# EAGLE design mbc_83_24_03_23 (EAGLE 7.6.0)

## Sheet 1 of 3
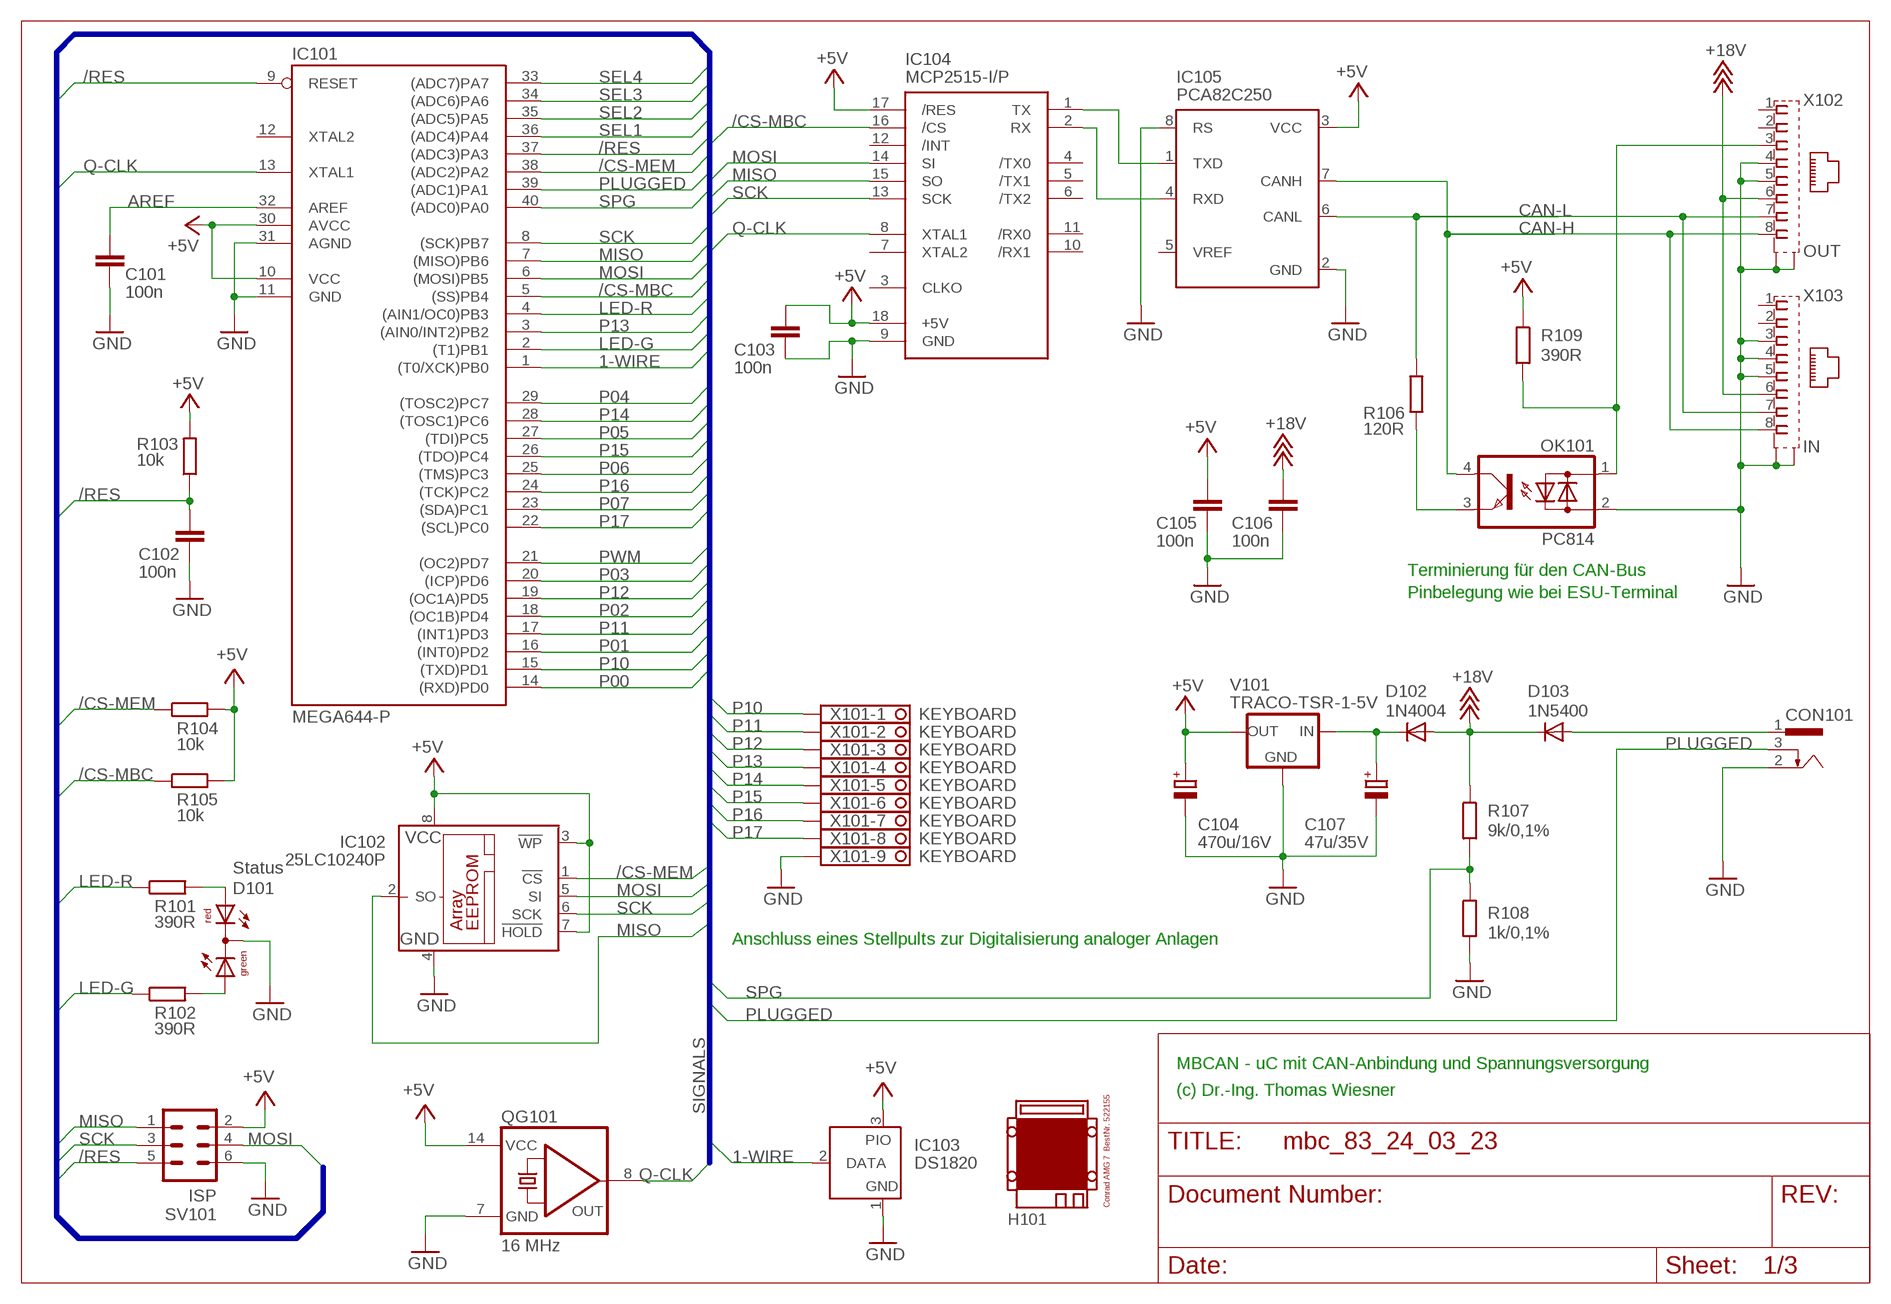
[diagram p0: schematic, sheet 1]

### Parts
C101  100n  C-EU025-025X050  [C025-025X050]
C102  100n  C-EU025-025X050  [C025-025X050]
C103  100n  C-EU025-025X050  [C025-025X050]
C104  470u/16V  CPOL-EUE3.5-8  [E3,5-8]
C105  100n  C-EU025-025X050  [C025-025X050]
C106  100n  C-EU025-025X050  [C025-025X050]
C107  47u/35V  CPOL-EUE2.5-7  [E2,5-7]
CON101  POWER-JACK  [POWER-JACK]
D101  Status  DUOLED5MM  [DUOLED5MM]
D102  1N4004  [DO41-10]
D103  1N5400  [DO201-15]
H101  MODULGEHÄUSE-AMG-7  [MODULGEHÄUSE-AMG-7]
IC101  MEGA644-P  MEGA323-P  [DIL40]
IC102  25LC10240P  25LC040P  [DIL8]
IC103  DS1820  DS2405  [TO92-]
IC104  MCP2515-I/P  MCP2510-I/P  [DIL18]
IC105  PCA82C250  [DIL08]
OK101  PC814  [DIL04]
QG101  16 MHz  QG5860  [DIL14S]
R101  390R  R-EU_0207/10  [0207/10]
R102  390R  R-EU_0207/10  [0207/10]
R103  10k  R-EU_0207/10  [0207/10]
R104  10k  R-EU_0207/10  [0207/10]
R105  10k  R-EU_0207/10  [0207/10]
R106  120R  R-EU_0207/10  [0207/10]
R107  9k/0,1%  R-EU_0207/10  [0207/10]
R108  1k/0,1%  R-EU_0207/10  [0207/10]
R109  390R  R-EU_0207/10  [0207/10]
SV101  ISP  ML6  [ML6]
V101  TRACO-TSR-1-5V  [TRACO-TSR-1]
X101  KEYBOARD  1751316  [1751316]
X102  OUT  0446200002  [0446200002]
X103  IN  0446200002  [0446200002]

### Nets
1-WIRE: IC101.1((T0/XCK)PB0) IC103.2(DATA)
+5V: C103.1 C104.+ C105.1 IC101.10(VCC) IC101.30(AVCC) IC102.3(!WP) IC102.7(!HOLD) IC102.8(VCC) IC103.3(PIO) IC104.17(/RES) IC104.18(+5V) IC105.3(VCC) QG101.14(VCC) R103.2 R104.2 R105.2 R109.1 SV101.2 V101.OUT ; also sheet 2
+18V: C106.1 D102.A D103.C R107.1 X102.6 X103.6 ; also sheet 2,3
/CS-MBC: IC101.5((SS)PB4) IC104.16(/CS) R105.1
/CS-MEM: IC101.38((ADC2)PA2) IC102.1(!CS) R104.1
/RES: C102.1 IC101.9(RESET) IC101.37((ADC3)PA3) R103.1 SV101.5
AREF: C101.1 IC101.32(AREF)
CAN-H: IC105.7(CANH) OK101.4(C) X102.8 X103.8
CAN-L: IC105.6(CANL) R106.2 X102.7 X103.7
GND: C101.2 C102.2 C103.2 C104.- C105.2 C106.2 C107.- CON101.2 D101.K(C) IC101.11(GND) IC101.31(AGND) IC102.4(GND) IC103.1(GND) IC104.9(GND) IC105.2(GND) IC105.8(RS) OK101.2(AC2) QG101.7(GND) R108.2 SV101.6 V101.GND X101.9 X102.4 X102.5 X102.S@1(S1) X102.S@2(S2) X103.3 X103.4 X103.5 X103.S@1(S1) X103.S@2(S2) ; also sheet 2,3
LED-G: IC101.2((T1)PB1) R102.1
LED-R: IC101.4((AIN1/OC0)PB3) R101.1
MISO: IC101.7((MISO)PB6) IC102.2(SO) IC104.15(SO) SV101.1
MOSI: IC101.6((MOSI)PB5) IC102.5(SI) IC104.14(SI) SV101.4
N$1: IC104.1(TX) IC105.1(TXD)
N$2: IC104.2(RX) IC105.4(RXD)
N$3: OK101.3(E) R106.1
N$5: OK101.1(AC1) R109.2 X102.3
N$6: C107.+ D102.C V101.IN
N$9: D101.AR R101.2
N$13: D101.AG R102.2
P00: IC101.14((RXD)PD0) ; also sheet 2
P01: IC101.16((INT0)PD2) ; also sheet 2
P02: IC101.18((OC1B)PD4) ; also sheet 2
P03: IC101.20((ICP)PD6) ; also sheet 2
P04: IC101.29((TOSC2)PC7) ; also sheet 2
P05: IC101.27((TDI)PC5) ; also sheet 2
P06: IC101.25((TMS)PC3) ; also sheet 2
P07: IC101.23((SDA)PC1) ; also sheet 2
P10: IC101.15((TXD)PD1) X101.1
P11: IC101.17((INT1)PD3) X101.2
P12: IC101.19((OC1A)PD5) X101.3
P13: IC101.3((AIN0/INT2)PB2) X101.4
P14: IC101.28((TOSC1)PC6) X101.5
P15: IC101.26((TDO)PC4) X101.6
P16: IC101.24((TCK)PC2) X101.7
P17: IC101.22((SCL)PC0) X101.8
PLUGGED: CON101.3 IC101.39((ADC1)PA1)
PWM: IC101.21((OC2)PD7) ; also sheet 3
Q-CLK: IC101.13(XTAL1) IC104.8(XTAL1) QG101.8(OUT)
SCK: IC101.8((SCK)PB7) IC102.6(SCK) IC104.13(SCK) SV101.3
SEL1: IC101.36((ADC4)PA4) ; also sheet 2
SEL2: IC101.35((ADC5)PA5) ; also sheet 2
SEL3: IC101.34((ADC6)PA6) ; also sheet 2
SEL4: IC101.33((ADC7)PA7) ; also sheet 2
SPG: IC101.40((ADC0)PA0) R107.2 R108.1
V-NETZTEIL1: CON101.1 D103.A
Unconnected: IC101.12(XTAL2) IC104.3(CLKO) IC104.4(/TX0) IC104.5(/TX1) IC104.6(/TX2) IC104.7(XTAL2) IC104.10(/RX1) IC104.11(/RX0) IC104.12(/INT) IC105.5(VREF) X102.1 X102.2 X103.1 X103.2

### Buses
SIGNALS

### Notes on the sheet
- Terminierung für den CAN-Bus
- Pinbelegung wie bei ESU-Terminal
- Anschluss eines Stellpults zur Digitalisierung analoger Anlagen
- MBCAN - uC mit CAN-Anbindung und Spannungsversorgung
- (c) Dr.-Ing. Thomas Wiesner

## Sheet 2 of 3
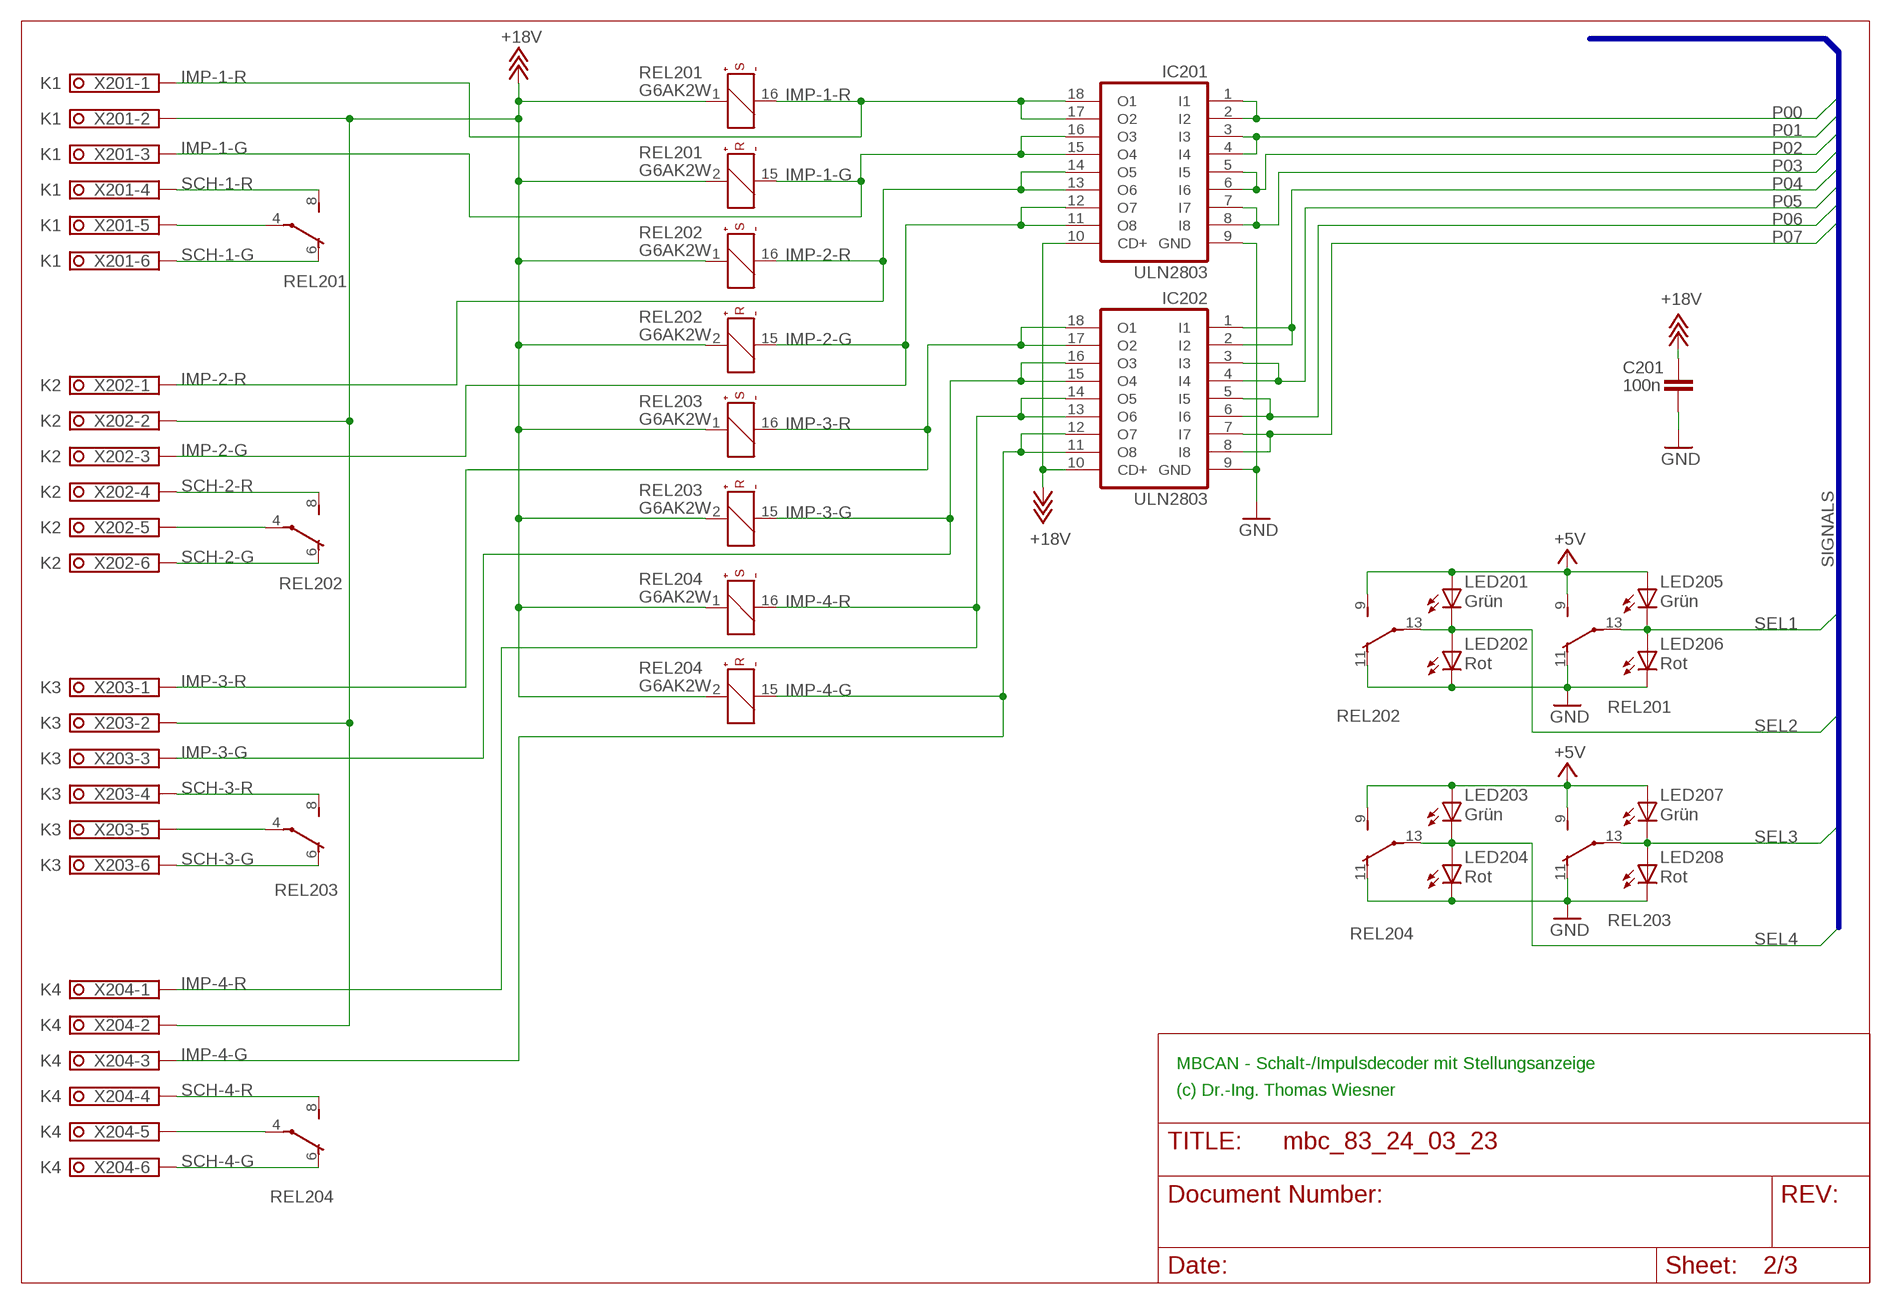
[diagram p1: schematic, sheet 2]

### Parts
C201  100n  C-EU025-025X050  [C025-025X050]
IC201  ULN2803  ULN2803A  [DIL18]
IC202  ULN2803  ULN2803A  [DIL18]
LED201  Grün  LED3MM  [LED3MM]
LED202  Rot  LED3MM  [LED3MM]
LED203  Grün  LED3MM  [LED3MM]
LED204  Rot  LED3MM  [LED3MM]
LED205  Grün  LED3MM  [LED3MM]
LED206  Rot  LED3MM  [LED3MM]
LED207  Grün  LED3MM  [LED3MM]
LED208  Rot  LED3MM  [LED3MM]
REL201  G6AK2W  [REL-BIPOLAR]
REL202  G6AK2W  [REL-BIPOLAR]
REL203  G6AK2W  [REL-BIPOLAR]
REL204  G6AK2W  [REL-BIPOLAR]
X201  K1  1751280  [1751280]
X202  K2  1751280  [1751280]
X203  K3  1751280  [1751280]
X204  K4  1751280  [1751280]

### Nets
+5V: LED201.A LED203.A LED205.A LED207.A REL201.9(S) REL202.9(S) REL203.9(S) REL204.9(S) ; also sheet 1
+18V: C201.1 IC201.10(CD+) IC202.10(CD+) REL201.1(+) REL201.2(+) REL202.1(+) REL202.2(+) REL203.1(+) REL203.2(+) REL204.1(+) REL204.2(+) X201.2 X202.2 X203.2 X204.2 ; also sheet 1,3
GND: C201.2 IC201.9(GND) IC202.9(GND) LED202.K(C) LED204.K(C) LED206.K(C) LED208.K(C) REL201.11(O) REL202.11(O) REL203.11(O) REL204.11(O) ; also sheet 1,3
IMP-1-G: IC201.15(O4) IC201.16(O3) REL201.15(-) X201.3 ; also sheet 3
IMP-1-R: IC201.17(O2) IC201.18(O1) REL201.16(-) X201.1 ; also sheet 3
IMP-2-G: IC201.11(O8) IC201.12(O7) REL202.15(-) X202.3 ; also sheet 3
IMP-2-R: IC201.13(O6) IC201.14(O5) REL202.16(-) X202.1 ; also sheet 3
IMP-3-G: IC202.15(O4) IC202.16(O3) REL203.15(-) X203.3 ; also sheet 3
IMP-3-R: IC202.17(O2) IC202.18(O1) REL203.16(-) X203.1 ; also sheet 3
IMP-4-G: IC202.11(O8) IC202.12(O7) REL204.15(-) X204.3 ; also sheet 3
IMP-4-R: IC202.13(O6) IC202.14(O5) REL204.16(-) X204.1 ; also sheet 3
N$12: REL202.4(P) X202.5
N$14: REL201.4(P) X201.5
N$15: REL203.4(P) X203.5
N$16: REL204.4(P) X204.5
P00: IC201.1(I1) IC201.2(I2) ; also sheet 1
P01: IC201.3(I3) IC201.4(I4) ; also sheet 1
P02: IC201.5(I5) IC201.6(I6) ; also sheet 1
P03: IC201.7(I7) IC201.8(I8) ; also sheet 1
P04: IC202.1(I1) IC202.2(I2) ; also sheet 1
P05: IC202.3(I3) IC202.4(I4) ; also sheet 1
P06: IC202.5(I5) IC202.6(I6) ; also sheet 1
P07: IC202.7(I7) IC202.8(I8) ; also sheet 1
SCH-1-G: REL201.6(O) X201.6 ; also sheet 3
SCH-1-R: REL201.8(S) X201.4
SCH-2-G: REL202.6(O) X202.6 ; also sheet 3
SCH-2-R: REL202.8(S) X202.4
SCH-3-G: REL203.6(O) X203.6 ; also sheet 3
SCH-3-R: REL203.8(S) X203.4
SCH-4-G: REL204.6(O) X204.6 ; also sheet 3
SCH-4-R: REL204.8(S) X204.4
SEL1: LED205.K(C) LED206.A REL201.13(P) ; also sheet 1
SEL2: LED201.K(C) LED202.A REL202.13(P) ; also sheet 1
SEL3: LED207.K(C) LED208.A REL203.13(P) ; also sheet 1
SEL4: LED203.K(C) LED204.A REL204.13(P) ; also sheet 1

### Buses
SIGNALS

### Notes on the sheet
- MBCAN - Schalt-/Impulsdecoder mit Stellungsanzeige
- (c) Dr.-Ing. Thomas Wiesner

## Sheet 3 of 3
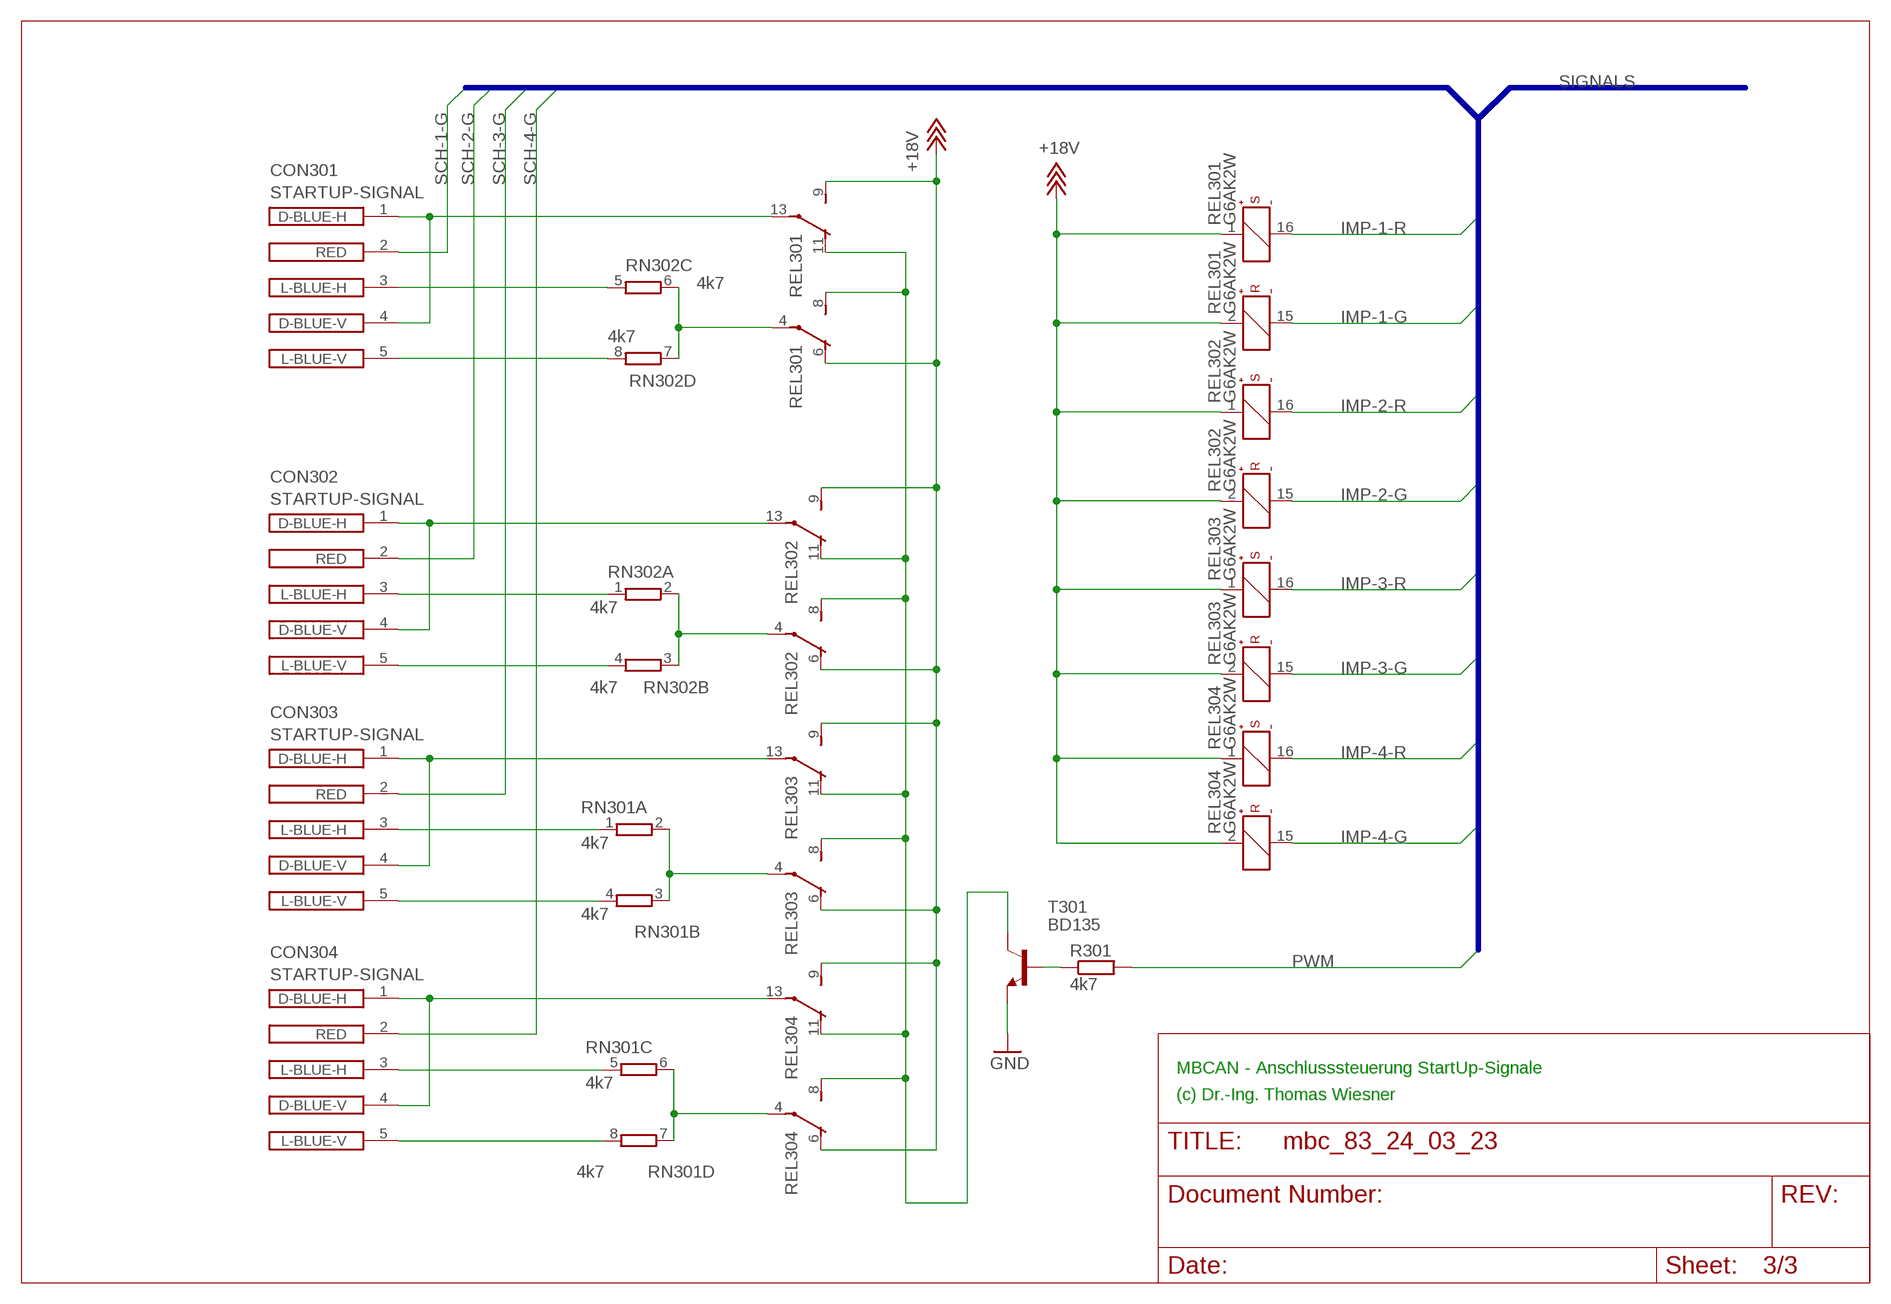
[diagram p2: schematic, sheet 3]

### Parts
CON301  STARTUP-SIGNAL  [SIGNAL-MAIN]
CON302  STARTUP-SIGNAL  [SIGNAL-MAIN]
CON303  STARTUP-SIGNAL  [SIGNAL-MAIN]
CON304  STARTUP-SIGNAL  [SIGNAL-MAIN]
R301  4k7  R-EU_0207/10  [0207/10]
REL301  G6AK2W  [REL-BIPOLAR]
REL302  G6AK2W  [REL-BIPOLAR]
REL303  G6AK2W  [REL-BIPOLAR]
REL304  G6AK2W  [REL-BIPOLAR]
RN301  4k7  E4R  [SIL8]
RN302  4k7  E4R  [SIL8]
T301  BD135  -NPN-TO126V  [TO126V]

### Nets
+18V: REL301.1(+) REL301.2(+) REL301.6(O) REL301.9(S) REL302.1(+) REL302.2(+) REL302.6(O) REL302.9(S) REL303.1(+) REL303.2(+) REL303.6(O) REL303.9(S) REL304.1(+) REL304.2(+) REL304.6(O) REL304.9(S) ; also sheet 1,2
GND: T301.1(E) ; also sheet 1,2
IMP-1-G: REL301.15(-) ; also sheet 2
IMP-1-R: REL301.16(-) ; also sheet 2
IMP-2-G: REL302.15(-) ; also sheet 2
IMP-2-R: REL302.16(-) ; also sheet 2
IMP-3-G: REL303.15(-) ; also sheet 2
IMP-3-R: REL303.16(-) ; also sheet 2
IMP-4-G: REL304.15(-) ; also sheet 2
IMP-4-R: REL304.16(-) ; also sheet 2
N$4: CON302.5(L-BLUE-V) RN302.4
N$7: CON301.1(D-BLUE-H) CON301.4(D-BLUE-V) REL301.13(P)
N$8: CON301.5(L-BLUE-V) RN302.8
N$10: CON303.5(L-BLUE-V) RN301.4
N$11: CON304.5(L-BLUE-V) RN301.8
N$17: R301.1 T301.3(B)
N$18: REL301.8(S) REL301.11(O) REL302.8(S) REL302.11(O) REL303.8(S) REL303.11(O) REL304.8(S) REL304.11(O) T301.2(C)
N$19: CON302.1(D-BLUE-H) CON302.4(D-BLUE-V) REL302.13(P)
N$20: CON302.3(L-BLUE-H) RN302.1
N$21: CON304.1(D-BLUE-H) CON304.4(D-BLUE-V) REL304.13(P)
N$23: CON304.3(L-BLUE-H) RN301.5
N$24: CON303.1(D-BLUE-H) CON303.4(D-BLUE-V) REL303.13(P)
N$26: CON301.3(L-BLUE-H) RN302.5
N$27: CON303.3(L-BLUE-H) RN301.1
N$29: REL301.4(P) RN302.6 RN302.7
N$30: REL302.4(P) RN302.2 RN302.3
N$31: REL303.4(P) RN301.2 RN301.3
N$32: REL304.4(P) RN301.6 RN301.7
PWM: R301.2 ; also sheet 1
SCH-1-G: CON301.2(RED) ; also sheet 2
SCH-2-G: CON302.2(RED) ; also sheet 2
SCH-3-G: CON303.2(RED) ; also sheet 2
SCH-4-G: CON304.2(RED) ; also sheet 2

### Buses
SIGNALS

### Notes on the sheet
- MBCAN - Anschlusssteuerung StartUp-Signale
- (c) Dr.-Ing. Thomas Wiesner

## Library data of the parts
C101-C103 C105 C106 C201 = rcl:C-EU: CAPACITOR, European symbol
C104 C107 = rcl:CPOL-EU: POLARIZED CAPACITOR, European symbol
CON101 = mbc:POWER-JACK: Power-Stecker für 2,5 mm Hohlbuchse
CON301-CON304 = mbc:STARTUP-SIGNAL: Connector für StartUp-Signale
D101 = led:DUOLED5MM: DUO LED 2 colors, 5 mm, round
D102 = diode:1N4004: DIODE general purpose rectifier, 1 A
D103 = diode:1N5400: DIODE standard rectifier, 3 A, 50 V (Motorola)
H101 = mbc:MODULGEHÄUSE-AMG-7: Gehäuse Conrad AMG 7 BestNr. 522155
IC101 = atmel:MEGA323-P: MICROCONTROLLER 32 Kbytes FLASH 2 Kbytes SRAM 1 Kbytes EEPROM USART 8-channel 10 bit ADC Source: avr.lbr; OC_FARNELL: unknown; OC_NEWARK: unknown
IC102 = microchip:25*: Serial EEPROM 4K/ 8K , SPI bus; MF: MICROCHIP; MPN: 25LC040/P; OC_FARNELL: 9758100; OC_NEWARK: 96K4091
IC103 = maxim:DS2405: Addressable Switch DALLAS Semiconductor; MF: DALLAS SEMICONDUCTOR; MPN: DS2405; OC_FARNELL: 1188025; OC_NEWARK: 06F4645
IC104 = mbc:MCP2510: BASIC-CAN 2.0a Controller Stand-alone CAN controller von Microchip
IC105 = micro-philips:PCA82C250: CAN CONTROLLER INTERFACE; OC_FARNELL: 3692358; OC_NEWARK: unknown
IC201 IC202 = uln-udn:ULN2803A: DRIVER ARRAY
LED201-LED208 = led:LED: LED OSRAM: - CHIPLED LG R971, LG N971, LY N971, LG Q971, LY Q971, LO R971, LY R971 LH N974, LH R974 LS Q976, LO Q976, LY Q976 LO Q996 - Hyper CHIPLED LW Q18S LB Q993, LB Q99A, LB R99A - SideLED LS A670, LO A670, LY A670, LG A670, LP A670 LB A673, LV A673, LT A673, LW A673 LH A674 LY A675 LS A676, LA A676, LO A676, LY A676, LW A676 LS A679, LY A679, LG A679 - Hyper Micro SIDELED® LS Y876, LA Y876, LO Y876, LY Y876 LT Y87S - SmartLED LW L88C, LW L88S LB L89C, LB L89S, LG L890 LS L89K, LO L89K, LY L89K LS L896, LA L896, LO L896, LY L896 - TOPLED LS T670, LO T670, LY T670, LG T670, LP T670 LSG T670, LSP T670, LSY T670, LOP T670, LYG T670 LG T671, LOG T671, LSG T671 LB T673, LV T673, LT T673, LW T673 LH T674 LS T676, LA T676, LO T676, LY T676, LB T676, LH T676, LSB T676, LW T676 LB T67C, LV T67C, LT T67C, LS T67K, LO T67K, LY T67K, LW E67C LS E67B, LA E67B, LO E67B, LY E67B, LB E67C, LV E67C, LT E67C LW T67C LS T679, LY T679, LG T679 LS T770, LO T770, LY T770, LG T770, LP T770 LB T773, LV T773, LT T773, LW T773 LH T774 LS E675, LA E675, LY E675, LS T675 LS T776, LA T776, LO T776, LY T776, LB T776 LHGB T686 LT T68C, LB T68C - Hyper Mini TOPLED® LB M676 - Mini TOPLED Santana® LG M470 LS M47K, LO M47K, LY M47K Source: http://www.osram.convergy.de LUXEON: - LUMILED® LXK2-PW12-R00, LXK2-PW12-S00, LXK2-PW14-U00, LXK2-PW14-V00 LXK2-PM12-R00, LXK2-PM12-S00, LXK2-PM14-U00 LXK2-PE12-Q00, LXK2-PE12-R00, LXK2-PE12-S00, LXK2-PE14-T00, LXK2-PE14-U00 LXK2-PB12-K00, LXK2-PB12-L00, LXK2-PB12-M00, LXK2-PB14-N00, LXK2-PB14-P00, LXK2-PB14-Q00 LXK2-PR12-L00, LXK2-PR12-M00, LXK2-PR14-Q00, LXK2-PR14-R00 LXK2-PD12-Q00, LXK2-PD12-R00, LXK2-PD12-S00 LXK2-PH12-R00, LXK2-PH12-S00 LXK2-PL12-P00, LXK2-PL12-Q00, LXK2-PL12-R00 Source: www.luxeon.com KINGBRIGHT: KA-3528ASYC Source: www.kingbright.com
OK101 = optocoupler:PC814: SHARP OPTO COUPLER; OC_FARNELL: 9707662; OC_NEWARK: unknown
QG101 = crystal:QG5860: CRYSTAL RESONATOR; OC_FARNELL: unknown; OC_NEWARK: unknown
R101-R109 R301 = resistor:R-EU_: RESISTOR, European symbol
REL201-REL204 REL301-REL304 = mbc:G6AK2W: Bipolares Relais 2xUM 12V
RN301 RN302 = resistor-sil:E4R: SIL RESISTOR; OC_FARNELL: unknown; OC_NEWARK: unknown
SV101 = con-ml:ML6: HARTING; OC_FARNELL: unknown; OC_NEWARK: unknown
T301 = transistor:*-NPN-: NPN Transistror BF959 corrected 2008.03.06
V101 = mbc:TRACO-TSR-1-5V: Spannungsregler Hersteller: TRACO Typ: TSR-1 5V: TSR 1-2450 Spg: 5V Strom: 1A Reichelt TSR 1-2450
X101 = con-phoenix-350:1751316: MKDS 1/ 9-3,5 Printklemme Nennstrom: 10 A Bemessungsspannung: 160 V Raster: 3,5 mm Polzahl: 9 Montageart: Löten Anschlussart: Schraubanschluss Anschlussrichtung vom Leiter zur Platine: 0° Source: http://eshop.phoenixcontact.com .. 1751316.pdf; OC_FARNELL: unknown; OC_NEWARK: unknown
X102 X103 = mbc:0446200002: RJ-45 INVERTED MODULAR JACK ASSEMBLY WITH RJ-11 KEEPOUT FEATURE Source: Data sheet <http://www.farnell.com/datasheets/73207.pdf> MOLEX 0446200002 BUCHSE, RJ45, GESCHIRMT Source: Farnell <http://de.farnell.com/molex/0446200002/buchse-rj45-geschirmt/dp/9251910?ost=9251910>; MF: MOLEX; MPN: 0446200002; OC_FARNELL: 9251910
X201-X204 = con-phoenix-350:1751280: MKDS 1/ 6-3,5 Printklemme Nennstrom: 10 A Bemessungsspannung: 160 V Raster: 3,5 mm Polzahl: 6 Montageart: Löten Anschlussart: Schraubanschluss Anschlussrichtung vom Leiter zur Platine: 0° Source: http://eshop.phoenixcontact.com .. 1751280.pdf; MPN: 1751280; OC_FARNELL: unknown; OC_NEWARK: 27R1765

## Board
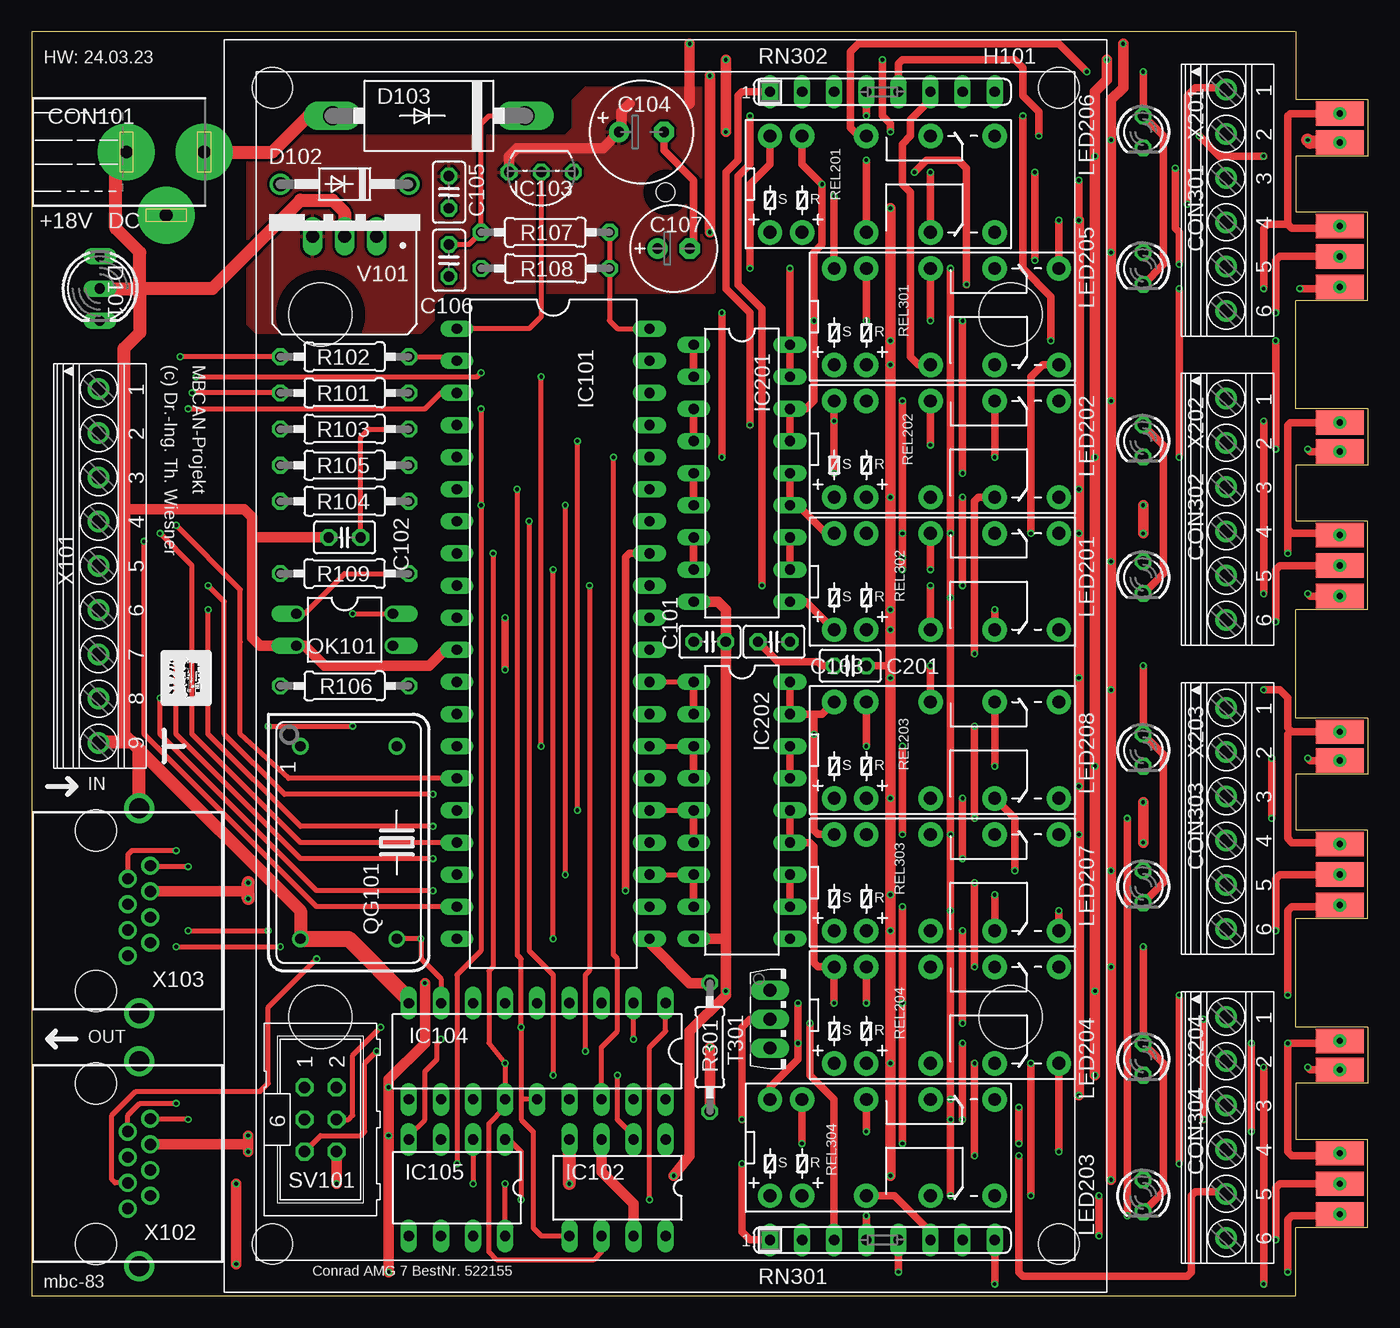
[diagram p3: board, top side]
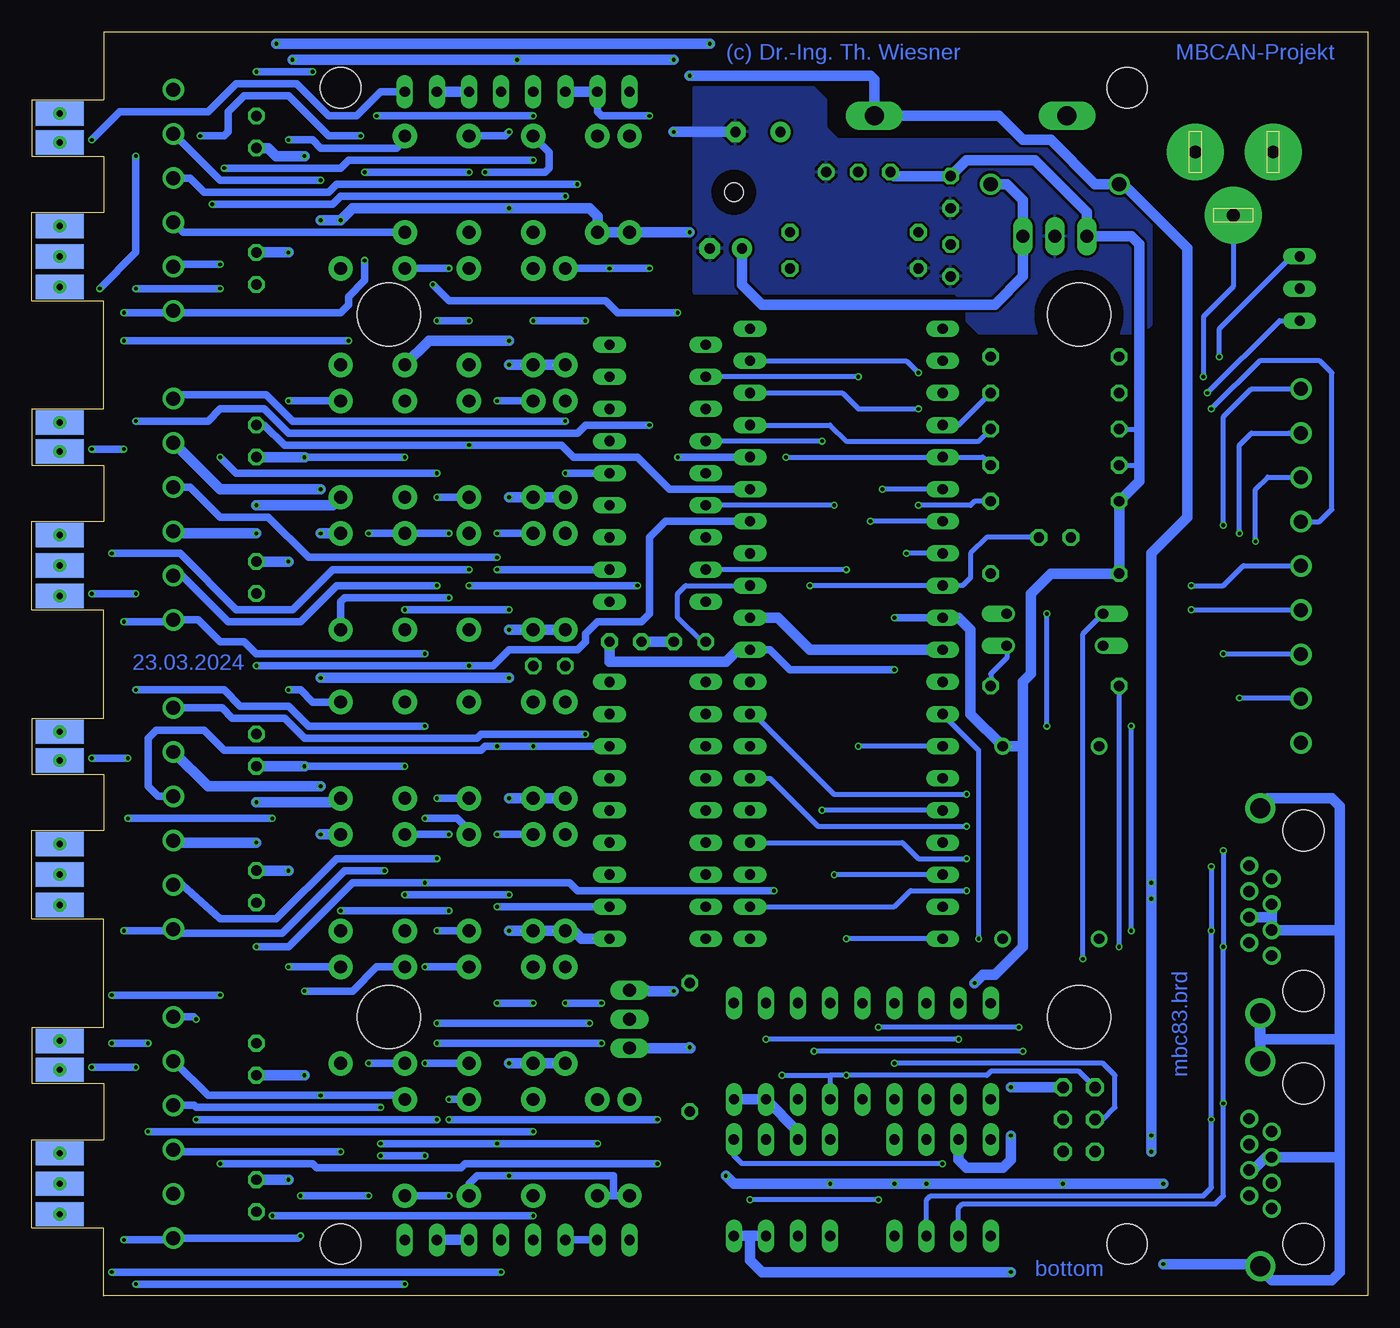
[diagram p4: board, bottom side, seen from below]

Size 105.73 x 100.01 mm. Coordinates in mm from the lower left corner, seen from the top.
Outline: 100,0.02 0,0.02 0,100.01 100,100.01
Outline: 100.01,100.01 100.01,94.61
Outline: 100.01,0 100.01,5.4
Outline: 100.01,21.27 100.01,29.84
Outline: 100.01,45.72 100.01,54.29
Outline: 100.01,70.17 100.01,78.74
Copper layers (1*16): Top 0.035mm / dielectric 1.5mm / Bottom 0.035mm
Design rules "default *": minimum track width 10mil, minimum drill 0.3mm, track to track 8mil, track to pad 8mil, pad to pad 8mil, via to via 8mil, smd to smd 8mil, copper to edge 40mil, drill to drill 8mil, minimum pad ring 10mil, minimum via ring 0.125mm, stop-mask expansion 4mil, vias tented up to drill 0mil, thermal gap 10mil

### Footprints (pad centres in the part's own frame; a part is rotated, then mirrored left to right if it is on the bottom)
C025-025X050 = drill 0.813 octagon: 1 -1.27,0; 2 1.27,0
E3,5-8 = drill 0.813 pad 1.6: + -1.778,0 | drill 0.813 pad 1.6 octagon: - 1.778,0
E2,5-7 = drill 0.813 pad 1.6: + -1.27,0 | drill 0.813 pad 1.6 octagon: - 1.27,0
POWER-JACK = drill 1 pad 4.5: 1 0,6.03; 2 0,-0.12; 3 5,3.03
SIGNAL-MAIN = smd 3.81 x 1.93: 1 -3.493,1.079; 2 -3.493,3.493; 3 -3.493,5.905; 4 -3.493,-7.811; 5 -3.493,-5.524 | smd 3.81 x 1.93 bottom: 6 -3.493,-5.524; 7 -3.493,-7.811; 8 -3.493,5.905; 9 -3.493,3.493; 10 -3.493,1.079 | drill 0.5 pad 0.813: P$7 -3.493,5.905; P$8 -3.493,3.493; P$9 -3.493,1.079; P$14 -3.493,-7.811; P$15 -3.493,-5.524
DUOLED5MM = drill 0.813 long: AG -2.54,0; AR 2.54,0; K 0,0
DO41-10 = drill 1.118: A 5.08,0; C -5.08,0
DO201-15 = drill 1.499 long: A 7.62,0; C -7.62,0
MODULGEHÄUSE-AMG-7 = hole 3.2: -45.72,-31.115; -45.72,31.115; 45.72,31.115; 45.72,-31.115 | hole 5: -27.781,-27.305; 27.781,-27.305; -27.781,27.305; 27.781,27.305 | hole 1.5: -37.465,0
DIL40 = drill 0.813 long: 1 -24.13,-7.62; 2 -21.59,-7.62; 3 -19.05,-7.62; 4 -16.51,-7.62; 5 -13.97,-7.62; 6 -11.43,-7.62; 7 -8.89,-7.62; 8 -6.35,-7.62; 9 -3.81,-7.62; 10 -1.27,-7.62; 11 1.27,-7.62; 12 3.81,-7.62; 13 6.35,-7.62; 14 8.89,-7.62; 15 11.43,-7.62; 16 13.97,-7.62; 17 16.51,-7.62; 18 19.05,-7.62; 19 21.59,-7.62; 20 24.13,-7.62; 21 24.13,7.62; 22 21.59,7.62; 23 19.05,7.62; 24 16.51,7.62; 25 13.97,7.62; 26 11.43,7.62; 27 8.89,7.62; 28 6.35,7.62; 29 3.81,7.62; 30 1.27,7.62; 31 -1.27,7.62; 32 -3.81,7.62; 33 -6.35,7.62; 34 -8.89,7.62; 35 -11.43,7.62; 36 -13.97,7.62; 37 -16.51,7.62; 38 -19.05,7.62; 39 -21.59,7.62; 40 -24.13,7.62
DIL8 = drill 0.813 long: 1 -3.81,-3.81; 2 -1.27,-3.81; 3 1.27,-3.81; 4 3.81,-3.81; 5 3.81,3.81; 6 1.27,3.81; 7 -1.27,3.81; 8 -3.81,3.81
TO92- = drill 0.813 octagon: 1 -2.54,0; 2 0,0; 3 2.54,0
DIL18 = drill 0.813 long: 1 -10.16,-3.81; 2 -7.62,-3.81; 3 -5.08,-3.81; 4 -2.54,-3.81 | drill 0.8 long: 5 0,-3.81; 6 2.54,-3.81; 7 5.08,-3.81; 8 7.62,-3.81; 9 10.16,-3.81; 10 10.16,3.81; 11 7.62,3.81; 12 5.08,3.81; 13 2.54,3.81; 14 0,3.81; 15 -2.54,3.81; 16 -5.08,3.81; 17 -7.62,3.81; 18 -10.16,3.81
DIL08 = drill 0.813 long: 1 -3.81,-3.81; 2 -1.27,-3.81; 3 1.27,-3.81; 4 3.81,-3.81; 5 3.81,3.81; 6 1.27,3.81; 7 -1.27,3.81; 8 -3.81,3.81
DIL18' = drill 0.813 long: 1 -10.16,-3.81; 2 -7.62,-3.81; 3 -5.08,-3.81; 4 -2.54,-3.81; 5 0,-3.81; 6 2.54,-3.81; 7 5.08,-3.81; 8 7.62,-3.81; 9 10.16,-3.81; 10 10.16,3.81; 11 7.62,3.81; 12 5.08,3.81; 13 2.54,3.81; 14 0,3.81; 15 -2.54,3.81; 16 -5.08,3.81; 17 -7.62,3.81; 18 -10.16,3.81
LED3MM = drill 0.813 octagon: A -1.27,0; K 1.27,0
DIL04 = drill 0.813 offset: 1 -1.27,-3.81; 2 1.27,-3.81; 3 1.27,3.81; 4 -1.27,3.81
DIL14S = drill 0.813: 1 -7.62,-3.81; 7 7.62,-3.81; 8 7.62,3.81; 14 -7.62,3.81
0207/10 = drill 0.813 octagon: 1 -5.08,0; 2 5.08,0
REL-BIPOLAR = drill 1.016 pad 1.93: 1 -8.89,-3.81; 2 -6.35,-3.81; 4 -1.27,-3.81; 6 3.81,-3.81; 8 8.89,-3.81; 9 8.89,3.81; 11 3.81,3.81; 13 -1.27,3.81; 15 -6.35,3.81; 16 -8.89,3.81
SIL8 = drill 0.813 long: 1 -8.89,0; 2 -6.35,0; 3 -3.81,0; 4 -1.27,0; 5 1.27,0; 6 3.81,0; 7 6.35,0; 8 8.89,0
ML6 = drill 0.914 octagon: 1 -2.54,-1.27; 2 -2.54,1.27; 3 0,-1.27; 4 0,1.27; 5 2.54,-1.27; 6 2.54,1.27
TO126V = drill 1.016 long: 1 -2.286,-1.27; 2 0,-1.27; 3 2.286,-1.27
TRACO-TSR-1 = drill 1.016 long: GND 0,2.54; IN -2.54,2.54; OUT 2.54,2.54
1751316 = drill 1.1 pad 1.7: 1 -13.973,-0.1; 2 -10.473,-0.1; 3 -6.973,-0.1; 4 -3.473,-0.1; 5 0.028,-0.1; 6 3.527,-0.1; 7 7.027,-0.1; 8 10.527,-0.1; 9 14.027,-0.1
0446200002 = drill 0.889 pad 1.422: 1 3.556,2.54; 2 2.54,4.318; 3 1.524,2.54; 4 0.508,4.318; 5 -0.508,2.54; 6 -1.524,4.318; 7 -2.54,2.54; 8 -3.556,4.318 | drill 1.575 pad 2.286: S@1 -8.103,3.429; S@2 8.103,3.429 | hole 3.251: 6.35,0; -6.35,0
1751280 = drill 1.1 pad 1.7: 1 -8.75,-0.1; 2 -5.25,-0.1; 3 -1.75,-0.1; 4 1.75,-0.1; 5 5.25,-0.1; 6 8.75,-0.1

### Placement (x,y rotation side)
C101  53.66,51.75 0 top
C102  24.77,60.01 180 top
C103  58.74,51.75 180 top
C104  48.26,92.08 0 top
C105  33.02,87.31 270 top
C106  33.02,81.92 270 top
C107  50.8,82.87 0 top
C201  64.77,49.85 180 top
CON101  7.62,90.49 270 top
CON301  100.01,85.72 180 top
CON302  100.01,61.28 180 top
CON303  100.01,36.83 180 top
CON304  100.01,12.38 180 top
D101  5.4,79.69 270 top
D102  24.77,87.95 180 top
D103  31.43,93.34 180 top
H101  50.16,49.85 270 top
IC101  41.27,52.39 270 top
IC102  46.35,8.57 180 top
IC103  40.32,88.9 180 top
IC104  40.01,19.37 180 top
IC105  33.66,8.57 180 top
IC201  ULN2803  [DIL18']  56.2,65.09 270 top
IC202  ULN2803  [DIL18']  56.2,38.42 270 top
LED201  87.95,56.83 270 top
LED202  87.95,67.63 270 top
LED203  87.95,7.94 270 top
LED204  87.95,18.73 270 top
LED205  87.95,81.28 270 top
LED206  87.95,92.08 270 top
LED207  87.95,32.38 270 top
LED208  87.95,43.18 270 top
OK101  24.77,52.7 270 top
QG101  25.08,35.88 270 top
R101  24.77,71.44 180 top
R102  24.77,74.3 180 top
R103  24.77,68.58 180 top
R104  24.77,62.87 180 top
R105  24.77,65.72 180 top
R106  24.77,48.26 180 top
R107  40.64,84.14 0 top
R108  40.64,81.28 180 top
R109  24.77,57.15 0 top
R301  53.66,19.68 90 top
REL201  67.31,87.95 0 top
REL202  72.39,66.99 0 top
REL203  72.39,43.18 0 top
REL204  72.39,22.23 0 top
REL301  72.39,77.47 0 top
REL302  72.39,56.52 0 top
REL303  72.39,32.7 0 top
REL304  67.31,11.75 0 top
RN301  67.31,4.45 0 top
RN302  67.31,95.25 0 top
SV101  22.86,13.97 270 top
T301  59.69,21.91 270 top
V101  24.77,86.36 180 top
X101  5.4,57.78 270 top
X102  5.08,10.48 270 top
X103  5.08,30.48 270 top
X201  94.61,86.68 270 top
X202  94.61,62.23 270 top
X203  94.61,37.78 270 top
X204  94.61,13.34 270 top

### Tracks (layer width: path | path; a pad name or v marks a point on that pad's centre or on a via)
1-WIRE
  Top 0.406: IC103.2 40.32,77.47 39.37,76.52 IC101.1
+5V  (via drill 0.3)
  Top 0.61: v37.47,49.53 v37.47,53.66
  Top 0.813: v31.11,24.77 31.11,20 28.26,17.14 v28.26,16.51 v28.26,12.7 v28.26,1.91 | 47.31,94.3 46.67,93.66 46.67,92.27 C104.+ 45.21,90.81 38.42,90.81 37.78,90.17 IC103.3 | IC102.3 45.09,9.84 47.62,7.3 IC102.7 | v85.41,9.21 v85.41,26.04 v85.41,33.66 v85.41,47.94 v85.41,58.1 v85.41,70.8 v85.41,82.55 v85.41,91.44 85.41,94.61 86.36,95.57 v86.36,99.06 | v52.07,99.06 52.07,94.3
  Bottom 0.406: R103.2 18.1,68.58 | R105.2 18.41,65.72 18.1,66.04
  Bottom 0.61: IC101.30 47.31,51.12 45.72,49.53 v37.47,49.53 | v37.47,53.66 IC101.10 | REL204.9 v85.41,26.04 | REL203.9 83.5,46.99 84.45,47.94 v85.41,47.94 | REL202.9 v85.41,70.8 | REL201.9 76.2,91.44 76.83,90.81 82.87,90.81 83.5,91.44 v85.41,91.44
  Bottom 0.813: v28.26,1.91 47.94,1.91 48.9,2.86 48.9,4.76 | IC101.10 32.38,53.66 31.43,52.7 31.43,46.04 QG101.14 27.3,43.5 | v28.26,12.7 28.26,10.79 28.89,10.16 31.75,10.16 32.38,10.79 IC105.3 | v31.11,24.77 30.48,25.4 29.53,25.4 27.3,27.62 27.3,43.5 | 48.9,4.76 IC102.7 | IC102.8 48.9,4.76 | IC104.18 IC104.17 45.09,13.02 IC102.3 | 27.3,43.5 27.3,48.58 26.67,49.21 26.67,55.56 25.08,57.15 R109.1 R104.2 18.1,64.45 18.1,66.04 18.1,68.58 18.1,83.19 18.73,83.82 V101.OUT 22.23,85.72 26.35,89.85 31.75,89.85 C105.1 37.47,88.58 IC103.3 | SV101.2 v28.26,16.51 | IC101.30 49.85,51.12 50.8,50.16 60.01,50.16 C103.1 | LED203.A v85.41,9.21 | v86.36,99.06 v52.07,99.06 | LED205.A v85.41,82.55 | LED201.A v85.41,58.1 | LED207.A v85.41,33.66
  pour Top: 17.14,76.83 17.14,91.76 42.23,91.76 42.86,92.39 42.86,94.61 43.81,95.57 53.98,95.57 53.98,79.38 32.7,79.38 31.75,78.42 31.75,77.15 30.8,76.2 17.78,76.2
+18V  (via drill 0.3)
  Top 0.406: C106.1 34.61,83.19 R107.1 35.56,92.71 36.2,93.34 D103.C
  Top 0.61: IC201.10 61.28,54.93 REL302.1 | REL301.9 v81.28,85.09 | v82.87,88.27 v82.87,85.09 | REL303.6 v76.2,31.75 | REL302.6 v76.2,54.29 | C201.1 67.63,49.85 67.94,49.53
  Top 0.813: v17.14,11.43 17.14,12.06 | 17.14,12.06 v17.14,12.7 | X102.6 17.08,12 17.14,12.06 | X103.6 16.9,32 | v67.94,86.04 v67.94,75.56 v67.94,73.66 v67.94,63.18 v67.94,54.29 v67.94,52.7 67.94,49.53 v67.94,48.9 v67.94,39.37 v67.94,31.75 v67.94,28.89 v67.94,18.41 v67.94,9.53 | v82.87,85.09 v82.87,63.82 v82.87,60.33 v82.87,48.9 v82.87,40.32 v82.87,36.51 v82.87,15.88 | v53.66,84.14 v53.66,96.52
  Top 1.016: 16.9,32 17.14,31.76 v17.14,31.43 v17.14,32.7
  Bottom 0.61: REL304.2 59.69,7.94 | 59.69,7.94 REL304.1 | 59.69,7.94 59.69,9.53 v67.94,9.53 70.48,9.53 71.12,8.89 REL304.6 | 94.47,18.59 91.76,15.88 v82.87,15.88 76.52,15.88 REL304.9 | 94.47,91.93 90.81,88.27 v82.87,88.27 | v76.2,31.75 v67.94,31.75 | v76.2,54.29 v67.94,54.29
  Bottom 0.813: v17.14,11.43 v17.14,12.7 v17.14,31.43 v17.14,32.7 17.14,58.74 14.29,61.59 14.29,82.87 19.37,87.95 D102.A 21.59,87.95 25.08,91.44 27.3,91.44 29.21,93.34 D103.C 39.05,96.2 39.37,96.52 v53.66,96.52 | v53.66,84.14 REL201.1 REL201.2 60.96,85.41 61.59,86.04 v67.94,86.04 80.33,86.04 v81.28,85.09 v82.87,85.09 | REL204.1 REL204.2 v67.94,18.41 | IC202.10 62.23,28.26 62.87,28.89 REL303.1 REL303.2 v67.94,28.89 | REL203.1 REL203.2 v67.94,39.37 | REL302.1 REL302.2 v67.94,52.7 | REL202.2 REL202.1 v67.94,63.18 | REL301.1 REL301.2 v67.94,73.66 | REL301.6 74.3,75.56 v67.94,75.56 | X204.2 94.47,18.59 | X203.2 94.47,43.03 91.76,40.32 v82.87,40.32 | X202.2 94.47,67.48 90.81,63.82 v82.87,63.82 | REL302.9 v82.87,60.33 | REL303.9 v82.87,36.51 | X201.2 94.47,91.93 | v82.87,48.9 v67.94,48.9
/CS-MBC  (via drill 0.3)
  Top 0.406: IC104.16 45.09,19.68 46.35,20.95 46.35,26.67 46.04,26.99 v46.04,66.36
  Bottom 0.406: R105.1 30.48,66.36 IC101.5 v46.04,66.36
/CS-MEM  (via drill 0.3)
  Top 0.406: v35.56,70.17 v35.56,62.55 35.56,27.3 33.66,25.4 v33.66,10.48
  Bottom 0.406: IC101.38 41.59,71.44 40.32,70.17 v35.56,70.17 | R104.1 31.11,62.87 31.43,62.55 v35.56,62.55 | v33.66,10.48 49.53,10.48 50.16,11.11 IC102.1
/RES  (via drill 0.3)
  Top 0.406: v44.13,56.2 44.13,25.72 43.81,25.4 v43.81,19.37 | C102.1 26.04,67.94 26.67,68.58 R103.1 | SV101.5 22.86,12.7 26.04,12.7 26.35,13.02 26.35,18.41 v27.3,19.37
  Bottom 0.406: IC101.37 42.55,68.9 41.27,67.63 30.8,67.63 R103.1 | v44.13,56.2 IC101.9 32.07,56.2 31.43,56.83 31.43,58.74 30.16,60.01 C102.1 | v27.3,19.37 v43.81,19.37
AREF
  Bottom 0.406: C101.1 52.7,51.75 54.61,53.66 54.61,55.56 53.98,56.2 IC101.32
CAN-H  (via drill 0.3)
  Top 0.406: X102.8 12.32,14.03 v12.38,13.97 | v12.38,33.97 9.46,33.97 X103.8 | v12.38,28.89 v18.73,28.89 | v18.73,45.09 v25.4,45.09 | v25.4,53.98 OK101.4
  Bottom 0.406: IC105.7 34.92,7.62 34.61,7.94 13.02,7.94 12.38,8.57 v12.38,13.97 v12.38,28.89 v12.38,33.97 | v18.73,28.89 v18.73,45.09 | v25.4,45.09 v25.4,53.98
CAN-L  (via drill 0.3)
  Top 0.406: X102.7 7.62,14.29 8.57,15.24 v11.43,15.24 | v11.43,35.24 7.94,35.24 7.62,34.92 X103.7 | v11.43,27.62 v19.68,27.62
  Bottom 0.406: IC105.6 32.38,6.99 32.07,7.3 12.06,7.3 11.43,7.94 v11.43,15.24 v11.43,27.62 v11.43,35.24 | v19.68,27.62 R106.2
GND  (via drill 0.3)
  Top 0.406: IC105.8 v37.47,8.89 | IC105.2 v34.92,8.89
  Top 0.61: C104.- 50.04,90.61 52.39,88.27 52.39,83.5 52.07,83.19 C107.- | 54.93,23.81 v54.93,24.13 | REL203.11 v76.2,41.91 | v76.2,66.36 REL202.11 | v67.94,92.08 67.94,92.71 67.31,93.34 v67.31,97.79 | C103.2 59.05,50.16 62.23,50.16 62.55,49.85 C201.2
  Top 0.813: 7.3,62.23 16.83,62.23 17.46,61.59 17.46,60.01 | 7.88,43.76 arc90 7.94,43.81 | IC202.9 54.93,28.26 | 54.93,28.26 v54.93,24.13 | 54.93,28.26 C101.2 54.93,54.29 54.29,54.93 IC201.9 | 17.46,60.01 17.46,52.07 18.1,51.44 OK101.2 21.59,51.44 23.18,49.85 31.43,49.85 32.7,51.12 IC101.11 | C102.2 17.46,60.01 | v50.8,9.53 52.07,11.11 52.07,20.95 54.93,23.81 | SV101.6 v24.13,8.89 | v16.19,2.54 v16.19,8.89 | v84.14,17.46 v84.14,24.13 v84.14,41.91 v84.14,66.36 v84.14,90.17 84.14,95.25 85.09,96.2 v85.09,97.79 | v54.93,97.79 v54.93,92.08
  Top 1.016: 8.57,79.69 14.29,79.69 21.27,86.68 23.81,86.68 24.77,85.72 V101.GND | D101.K 8.57,79.69 | 8.57,79.69 8.57,76.2 7.3,74.93 7.3,62.23 7.3,44.45 7.94,43.81 | v42.55,8.89 IC102.4 | 7.94,43.81 8.57,43.18 | 8.57,43.18 21.27,30.48 QG101.7 | 8.57,79.69 8.57,82.55 6.67,84.45 6.67,89.66 CON101.2 | 7.94,43.81 5.36,43.81 X101.9 | X103.S@1 8.51,43.12 8.57,43.18
  Top 1.27: IC104.9 29.84,23.5 25.08,28.26 QG101.7
  Bottom 0.61: 50.16,91.95 C104.- | X102.S@2 8.41,2.38 8.26,2.22 | REL204.11 78.42,26.04 80.33,24.13 v84.14,24.13 | v76.2,41.91 v84.14,41.91 | v84.14,66.36 v76.2,66.36 | REL201.11 68.26,91.76 v67.94,92.08
  Bottom 0.813: IC101.11 44.13,51.12 46.67,53.66 IC101.31 | v50.8,9.53 50.16,8.89 v42.55,8.89 v37.47,8.89 v34.92,8.89 v24.13,8.89 v16.19,8.89 | X102.S@2 8.67,2.54 v16.19,2.54 | 8.26,2.22 8.26,1.91 7.62,1.27 2.86,1.27 2.22,1.91 2.22,11.11 | 2.22,11.11 2.22,20.32 | 2.22,20.32 2.22,28.89 | 2.22,28.89 2.22,38.73 2.86,39.37 7.94,39.37 8.57,38.73 8.57,38.65 X103.S@1 | X102.S@1 X103.S@2 8.57,22.31 8.57,20.32 2.22,20.32 | 2.22,28.89 2.29,28.96 X103.3 7.62,30.16 | X103.5 7.62,30.16 | X103.4 7.81,29.97 7.62,30.16 | 2.22,11.11 2.35,10.99 X102.5 8.06,10.99 8.89,10.16 9.21,10.16 X102.4 | C103.2 C101.2 | 58.48,24.13 T301.1 57.09,24.19 56.83,24.13 v54.93,24.13 | LED204.K v84.14,17.46 | v85.09,97.79 v67.31,97.79 v54.93,97.79 | v54.93,92.08 C104.- | LED206.K 87,90.81 86.36,90.17 v84.14,90.17 | LED202.K v84.14,66.36 | LED208.K v84.14,41.91
  pour Bottom: 17.78,91.44 41.91,91.44 42.86,92.39 42.86,94.61 43.81,95.57 53.34,95.57 53.34,79.38 32.7,79.38 31.75,78.42 31.75,77.15 30.8,76.2 17.78,76.2 17.14,76.83 17.14,90.81
IMP-1-G  (via drill 0.3)
  Top 0.61: IC201.15 IC201.16 61.28,70.17 61.91,70.8 v61.91,77.15 61.91,82.55 62.55,83.19 v62.55,87.95 60.96,89.53 REL201.15 | v66.04,77.15 REL301.15
  Bottom 0.61: v61.91,77.15 v66.04,77.15 | X201.3 93.19,88.43 92.08,87.31 82.23,87.31 81.6,87.95 v62.55,87.95
IMP-1-R  (via drill 0.3)
  Top 0.61: IC201.17 IC201.18 v60.01,81.28 | REL201.16 58.42,89.53 56.83,87.95 v56.83,81.28 | REL301.16 v63.5,87 | v91.44,86.36 91.44,94.93 92.08,95.57 94.38,95.57 X201.1
  Bottom 0.61: REL301.16 v60.01,81.28 v56.83,81.28 | v63.5,87 81.28,87 81.92,86.36 v91.44,86.36
IMP-2-G  (via drill 0.3)
  Top 0.61: IC201.11 IC201.12 | v68.9,70.8 v68.9,60.33 v68.9,58.42 v68.9,57.47
  Bottom 0.61: REL202.15 v68.9,70.8 | v68.9,57.47 IC201.11 | REL302.15 v68.9,60.33 | X202.3 93.19,63.98 90.81,61.59 87,61.59 83.82,58.42 v68.9,58.42
IMP-2-R  (via drill 0.3)
  Top 0.61: IC201.14 IC201.13 60.64,62.55 62.87,60.33 REL302.16 | v63.5,65.09 v63.5,69.22 REL202.16
  Bottom 0.61: IC201.14 v63.5,65.09 | v63.5,69.22 85.09,69.22 87.17,71.3 94.2,71.3 X202.1
IMP-3-G  (via drill 0.3)
  Top 0.61: IC202.16 IC202.15 | v68.9,43.5 v68.9,36.51 | REL203.15 v66.04,43.5
  Bottom 0.61: IC202.16 v66.04,43.5 v68.9,43.5 69.85,43.5 70.17,43.18 90.49,43.18 92.08,44.77 95.89,44.77 96.52,44.13 96.52,40.32 95.73,39.53 X203.3 | v68.9,36.51 REL303.15
IMP-3-R  (via drill 0.3)
  Top 0.61: IC202.18 IC202.17 61.91,46.04 | 61.91,46.04 v61.91,44.45 61.91,36.83 62.23,36.51 REL303.16 | 61.91,46.04 62.55,46.04 REL203.16
  Bottom 0.61: X203.1 90.67,46.53 89.85,45.72 85.72,45.72 84.14,44.13 70.48,44.13 70.17,44.45 v61.91,44.45
IMP-4-G  (via drill 0.3)
  Top 0.61: IC202.11 IC202.12 | REL204.15 v66.04,23.18 | v68.9,30.8 v68.9,23.18 v68.9,12.06 | v78.11,14.92 v78.11,12.06 | v60.96,12.06 REL304.15
  Bottom 0.61: IC202.11 v68.9,30.8 | X204.3 92.87,15.09 92.71,14.92 v78.11,14.92 | v78.11,12.06 v68.9,12.06 v60.96,12.06 | v66.04,23.18 v68.9,23.18
IMP-4-R  (via drill 0.3)
  Top 0.61: IC202.14 IC202.13 61.59,35.88 61.91,35.56 61.91,26.35 62.23,26.04 REL204.16 v63.5,23.18 | v60.64,23.18 v60.64,20 60.64,18.73 58.42,16.51 REL304.16 | v92.71,21.91 v92.71,13.97 | v73.66,13.97 v73.66,20
  Bottom 0.61: v63.5,23.18 v60.64,23.18 | X204.1 92.89,22.09 v92.71,21.91 | v92.71,13.97 v73.66,13.97 | v73.66,20 v60.64,20
LED-G
  Top 0.406: R102.1 32.7,74.3 33.02,73.98 IC101.2
LED-R
  Bottom 0.406: IC101.4 32.38,68.9 R101.1
MISO  (via drill 0.3)
  Top 0.406: IC102.2 47.62,12.7 46.35,13.97 v46.35,17.46 | v39.37,61.28 39.37,27.3 41.27,25.4 v41.27,17.46
  Bottom 0.406: SV101.1 22.86,17.78 29.84,17.78 30.16,17.46 v41.27,17.46 42.55,17.46 | 42.55,17.46 IC104.15 | v46.35,17.46 42.55,17.46 | IC101.7 v39.37,61.28
MOSI  (via drill 0.3)
  Top 0.406: v38.42,63.82 38.42,26.99 38.73,26.67 v38.73,21.27 38.73,15.56 | SV101.4 25.08,13.97 25.4,14.29 25.4,19.05 v27.62,21.27 | 38.73,15.56 38.73,13.97 39.69,13.02 39.69,5.4 40.32,4.76 IC102.5 | IC104.14 38.73,15.56
  Bottom 0.406: IC101.6 v38.42,63.82 | v27.62,21.27 v38.73,21.27
N$1  (via drill 0.3)
  Top 0.406: IC105.1 37.78,12.38 38.73,11.43 v38.73,7.62 | v48.9,7.62 48.9,19.68 50.16,20.95 IC104.1
  Bottom 0.406: v38.73,7.62 v48.9,7.62
N$2  (via drill 0.3)
  Top 0.406: IC105.4 29.84,12.7 31.11,13.97 31.11,17.78 32.07,18.73 32.07,20 v32.38,20.32 | v47.62,20.32 IC104.2
  Bottom 0.406: v32.38,20.32 v47.62,20.32
N$3
  Bottom 0.406: OK101.3 28.57,50.48 29.84,49.21 R106.1
N$4  (via drill 0.3)
  Top 0.61: CON302.5 101.16,66.8 v100.97,66.99 | v98.42,66.99 v98.42,75.56 | v80.64,75.56 80.64,79.06 78.42,81.28 v78.42,93.34 | v66.04,93.34 RN302.4
  Bottom 0.61: v100.97,66.99 v98.42,66.99 | v98.42,75.56 v80.64,75.56 | v78.42,93.34 v66.04,93.34
N$5  (via drill 0.3)
  Top 0.406: OK101.1 21.59,53.98 24.77,57.15 R109.2 | X102.3 6.6,8.95 6.35,9.21 6.35,14.29 8.26,16.19 18.1,16.19 18.73,16.83 18.73,22.86 v22.54,26.67
  Bottom 0.406: v22.54,26.67 22.54,52.39 OK101.1
N$6
  Bottom 0.813: D102.C 28.57,87.95 27.3,86.68 V101.IN 27.3,80.64 29.53,78.42 47.94,78.42 49.53,80.01 C107.+
N$7  (via drill 0.3)
  Top 0.61: CON301.4 99.57,93.53 99.38,93.34 99.38,84.77 | 99.38,84.77 99.69,84.45 103.31,84.45 CON301.1 | REL301.13 v71.12,77.15 | v73.66,77.15 v73.66,65.09 | v90.81,66.36 v90.81,79.69 | v97.47,79.69 97.47,84.45 97.79,84.77 99.38,84.77
  Bottom 0.61: v71.12,77.15 v73.66,77.15 | v73.66,65.09 89.53,65.09 v90.81,66.36 | v90.81,79.69 v97.47,79.69
N$8  (via drill 0.3)
  Top 1.016: CON301.5 101.16,91.25 v100.97,91.44
  Bottom 0.61: RN302.8 78.11,95.25 80.01,93.34 82.23,93.34 84.77,95.89 89.53,95.89 91.76,93.66 98.74,93.66 v100.97,91.44
N$9  (via drill 0.3)
  Top 0.406: R101.2 v12.7,71.44
  Bottom 0.406: v12.7,71.44 6.99,77.15 D101.AR
N$10  (via drill 0.3)
  Top 0.61: CON303.5 101.16,42.35 v100.97,42.55 | RN301.4 v66.04,6.35 | v86.68,6.35 v86.68,37.78 | v98.11,37.78 v98.11,42.55
  Bottom 0.61: v66.04,6.35 v86.68,6.35 | v86.68,37.78 v98.11,37.78 | v98.11,42.55 v100.97,42.55
N$11  (via drill 0.3)
  Top 0.61: CON304.5 101.16,17.91 v100.97,18.1 | RN301.8 v76.2,0.95 | v97.47,0.95 v97.47,18.1
  Bottom 0.61: v76.2,0.95 v97.47,0.95 | v97.47,18.1 v100.97,18.1
N$12  (via drill 0.3)
  Top 0.61: v73.66,56.2 v73.66,63.18
  Bottom 0.61: X202.5 93.81,56.98 90.17,53.34 84.45,53.34 81.6,56.2 v73.66,56.2 | v73.66,63.18 REL202.4
N$13  (via drill 0.3)
  Top 0.406: R102.2 v11.75,74.3
  Bottom 0.406: v11.75,74.3 11.75,76.52 6.03,82.23 D101.AG
N$14  (via drill 0.3)
  Top 0.61: v90.81,81.6 90.81,84.14 90.49,84.45 v90.49,89.22 | v66.04,89.85 REL201.4
  Bottom 0.61: X201.5 94.47,81.43 94.3,81.6 v90.81,81.6 | v90.49,89.22 81.28,89.22 80.64,89.85 v66.04,89.85
N$15  (via drill 0.3)
  Top 0.61: v73.66,34.61 v73.66,39.37
  Bottom 0.61: X203.5 93.81,32.53 90.81,29.84 86.36,29.84 81.6,34.61 v73.66,34.61 | v73.66,39.37 REL203.4
N$16  (via drill 0.3)
  Top 0.61: v74.61,18.41 v74.61,11.11 | v78.11,11.11 78.11,1.91 78.42,1.59 91.44,1.59 91.76,1.91 91.76,7.94 92.08,8.26 94.34,8.26 X204.5
  Bottom 0.61: REL204.4 v74.61,18.41 | v74.61,11.11 v78.11,11.11
N$17  (via drill 0.3)
  Top 0.813: v53.66,19.68 R301.1
  Bottom 0.813: T301.3 53.59,19.62 v53.66,19.68
N$18  (via drill 0.3)
  Top 0.61: v72.71,81.28 v72.71,60.33 v72.71,55.24 v72.71,36.51 v72.71,30.48 v72.71,15.56 v72.71,13.97 v72.71,7.94 | T301.2 56.83,21.91 56.2,21.27 v56.2,13.97 | REL303.8 v81.28,30.48 | REL301.8 80.01,73.66 79.06,72.71 v79.06,60.33
  Bottom 0.61: REL304.11 v72.71,15.56 | v72.71,81.28 REL301.11 | v72.71,7.94 REL304.8 | v56.2,13.97 v72.71,13.97 | v81.28,30.48 v72.71,30.48 | REL303.11 v72.71,36.51 | REL302.8 81.28,54.93 80.96,55.24 v72.71,55.24 | v72.71,60.33 REL302.11 v79.06,60.33
N$19  (via drill 0.3)
  Top 0.61: CON302.4 99.57,69.09 99.38,68.9 99.38,60.64 | 99.38,60.64 99.69,60.33 103.38,60.33 CON302.1 | REL302.13 v71.12,57.47 | v99.38,58.74 99.38,60.64
  Bottom 0.61: v71.12,57.47 81.92,57.47 85.09,54.29 89.53,54.29 93.98,58.74 v99.38,58.74
N$20  (via drill 0.3)
  Top 0.61: CON302.3 101.16,55.37 v100.97,55.56 | v97.47,55.56 v97.47,69.22 | v56.83,68.9 56.83,77.79 54.93,79.69 54.93,88.9 55.88,89.85 55.88,94.93 56.2,95.25 RN302.1
  Bottom 0.61: v100.97,55.56 v97.47,55.56 | v97.47,69.22 91.76,69.22 90.81,70.17 87.31,70.17 85.41,68.26 62.55,68.26 61.91,68.9 v56.83,68.9
N$21  (via drill 0.3)
  Top 0.61: CON304.1 102.11,11.3 101.92,11.11 99.69,11.11 99.38,11.43 v99.38,20 103.31,20 CON304.4 | v96.52,20 v96.52,13.02 | v66.04,13.02 REL304.13
  Bottom 0.61: v99.38,20 v96.52,20 | v96.52,13.02 v66.04,13.02
N$23  (via drill 0.3)
  Top 0.61: v99.38,1.91 99.38,6.03 99.69,6.35 103.38,6.35 CON304.3 | v68.58,1.91 RN301.5
  Bottom 0.61: v99.38,1.91 v68.58,1.91
N$24  (via drill 0.3)
  Top 0.61: CON303.4 99.69,44.64 | 99.69,44.64 99.57,44.64 99.38,44.45 99.38,36.2 99.69,35.88 103.38,35.88 CON303.1 | v74.61,37.78 v74.61,45.09 | v97.47,47.94 98.74,47.94 99.38,47.31 99.38,44.96 99.69,44.64
  Bottom 0.61: REL303.13 71.12,36.83 72.07,37.78 v74.61,37.78 | v74.61,45.09 83.82,45.09 85.41,46.67 89.22,46.67 90.49,47.94 v97.47,47.94
N$26  (via drill 0.3)
  Top 0.61: RN302.5 68.58,97.47 68.9,97.79 77.79,97.79 78.42,97.16 78.42,94.93 79.69,93.66 v79.69,91.76 | v92.39,91.76 93.98,90.17 v97.47,90.17 | v100.33,79.69 103.38,79.69 CON301.3
  Bottom 0.61: v79.69,91.76 82.23,91.76 85.41,94.93 88.9,94.93 90.17,93.66 90.17,92.08 90.49,91.76 v92.39,91.76 | v97.47,90.17 97.47,82.55 v100.33,79.69
N$27  (via drill 0.3)
  Top 0.61: RN301.1 56.83,4.45 56.2,5.08 v56.2,10.48 | v90.81,10.48 v90.81,23.81 | v99.38,23.81 99.38,30.48 99.69,30.8 103.38,30.8 CON303.3
  Bottom 0.61: v56.2,10.48 71.44,10.48 71.75,10.16 83.19,10.16 83.5,10.48 v90.81,10.48 | v90.81,23.81 v99.38,23.81
N$29
  Top 0.61: RN302.6 71.12,94.61 69.53,93.03 69.53,91.76 68.9,91.12 68.9,87.95 69.53,87.31 69.53,74.3 70.17,73.66 REL301.4
  Bottom 0.813: RN302.7 RN302.6
N$30  (via drill 0.3)
  Top 0.61: REL302.4 v71.12,56.2 | v57.78,56.2 57.78,78.11 55.88,80.01 55.88,88.58 56.83,89.53 v56.83,93.34
  Bottom 0.61: v71.12,56.2 v57.78,56.2 | v56.83,93.34 60.64,93.34 60.96,93.66 RN302.2
  Bottom 0.813: RN302.2 RN302.3
N$31  (via drill 0.3)
  Top 0.61: RN301.3 63.5,15.56 61.59,17.46 v61.59,21.59 | v73.66,21.59 v73.66,28.89
  Bottom 0.61: RN301.2 RN301.3 | v61.59,21.59 v73.66,21.59 | v73.66,28.89 REL303.4
N$32
  Top 0.61: REL304.4 68.26,7.94 71.12,5.08 RN301.6
  Bottom 0.813: RN301.7 RN301.6
P00  (via drill 0.3)
  Top 0.406: v40.32,43.5 v40.32,72.71
  Top 0.61: IC201.2 IC201.1
  Bottom 0.406: IC101.14 v40.32,43.5 | v40.32,72.71 IC201.2
P01  (via drill 0.3)
  Top 0.406: v43.18,38.42 v43.18,67.63
  Top 0.61: IC201.4 IC201.3
  Bottom 0.406: IC101.16 v43.18,38.42 | v43.18,67.63 IC201.4
P02  (via drill 0.3)
  Top 0.406: v42.23,33.34 v42.23,62.55
  Top 0.61: IC201.5 IC201.6
  Bottom 0.406: IC101.18 v42.23,33.34 | v42.23,62.55 IC201.6
P03  (via drill 0.3)
  Top 0.406: v41.27,28.26 v41.27,57.47
  Top 0.61: IC201.8 IC201.7
  Bottom 0.406: IC101.20 v41.27,28.26 | v41.27,57.47 IC201.8
P04
  Top 0.406: IC101.29 IC202.1
  Top 0.61: IC202.2 IC202.1
P05
  Top 0.406: IC101.27 IC202.3
  Top 0.61: IC202.3 IC202.4
P06
  Top 0.406: IC101.25 IC202.5
  Top 0.61: IC202.5 IC202.6
P07
  Top 0.406: IC101.23 IC202.7
  Top 0.61: IC202.7 IC202.8
P10  (via drill 0.3)
  Top 0.406: IC101.15 20.32,40.96 16.51,44.45 16.51,51.75 16.51,55.88 v11.43,60.96
  Bottom 0.406: v11.43,60.96 11.43,69.53 9.21,71.75 X101.1
P11  (via drill 0.3)
  Top 0.406: IC101.17 21.27,35.88 12.7,44.45 12.7,57.78 v10.16,60.33
  Bottom 0.406: v10.16,60.33 10.16,67.31 9.21,68.26 6.25,68.26 X101.2
P12  (via drill 0.3)
  Top 0.406: IC101.19 22.54,30.8 8.89,44.45 v8.89,59.69
  Bottom 0.406: v8.89,59.69 8.89,63.82 7.94,64.77 5.95,64.77 X101.3
P13  (via drill 0.3)
  Top 0.406: v12.38,70.17 31.11,70.17 32.38,71.44 IC101.3
  Bottom 0.406: X101.4 3.83,61.26 2.86,62.23 2.86,73.03 3.81,73.98 8.57,73.98 v12.38,70.17
P14  (via drill 0.3)
  Top 0.406: v31.75,39.69 20,39.69 15.24,44.45 15.24,54.93 v13.97,56.2
  Bottom 0.406: IC101.28 48.58,46.04 42.23,39.69 v31.75,39.69 | v13.97,56.2 11.43,56.2 9.84,57.78 5.33,57.78 X101.5
P15  (via drill 0.3)
  Top 0.406: v31.75,37.15 21.27,37.15 13.97,44.45 v13.97,54.29
  Bottom 0.406: IC101.26 47.31,40.96 43.5,37.15 v31.75,37.15 | v13.97,54.29 5.33,54.29 X101.6
P16  (via drill 0.3)
  Top 0.406: v31.75,34.61 21.27,34.61 11.43,44.45 v11.43,50.8
  Bottom 0.406: IC101.24 36.83,35.88 35.56,34.61 v31.75,34.61 | v11.43,50.8 5.34,50.8 X101.7
P17  (via drill 0.3)
  Top 0.406: v31.75,32.07 22.54,32.07 10.16,44.45 v10.16,47.31
  Bottom 0.406: IC101.22 37.47,30.8 36.2,32.07 v31.75,32.07 | v10.16,47.31 5.35,47.31 X101.8
PLUGGED  (via drill 0.3)
  Top 0.406: v13.02,72.71 35.24,72.71 v35.56,73.03
  Bottom 0.406: IC101.39 36.51,73.98 v35.56,73.03 | CON101.3 10.65,79.84 13.02,77.47 v13.02,72.71
PWM
  Top 0.813: IC101.21 48.9,27.94 52.07,24.77 R301.2
Q-CLK  (via drill 0.3)
  Top 0.406: IC104.8 32.38,25.08 30.8,26.67 v30.8,28.26 QG101.8
  Bottom 0.406: IC101.13 30.8,43.18 v30.8,28.26
SCH-1-G  (via drill 0.3)
  Top 0.61: CON301.2 98.74,82.23 98.42,81.92 v98.42,77.79 | REL201.6 v71.12,88.9 | v79.38,88.9 v79.38,81.92
  Bottom 0.61: v98.42,77.79 94.66,77.79 X201.6 94.38,77.79 81.28,77.79 80.64,78.42 80.64,79.06 79.38,80.33 v79.38,81.92 | v71.12,88.9 v79.38,88.9
SCH-1-R
  Bottom 0.61: REL201.8 93.72,84.14 X201.4
SCH-2-G  (via drill 0.3)
  Top 0.61: CON302.2 98.74,57.78 98.42,57.47 v98.42,53.34 | v74.61,50.8 74.61,62.87 74.93,63.18 REL202.6
  Bottom 0.61: v98.42,53.34 94.66,53.34 X202.6 92.53,53.48 90.81,51.75 88.9,51.75 87.95,50.8 v74.61,50.8
SCH-2-R  (via drill 0.3)
  Top 0.813: v87.95,62.55 v87.95,60.33
  Bottom 0.813: REL202.8 81.92,62.55 v87.95,62.55 | v87.95,60.33 94.36,60.33 X202.4
SCH-3-G  (via drill 0.3)
  Top 0.61: CON303.2 98.74,33.34 98.42,33.02 v98.42,28.89 | v77.79,33.66 77.79,37.78 REL203.6
  Bottom 0.61: v98.42,28.89 94.66,28.89 X203.6 94.52,28.71 85.9,28.71 80.96,33.66 v77.79,33.66
SCH-3-R  (via drill 0.3)
  Top 0.813: v87.95,39.05 v87.95,35.88
  Bottom 0.813: REL203.8 81.6,39.05 v87.95,39.05 | v87.95,35.88 94.36,35.88 X203.4
SCH-4-G  (via drill 0.3)
  Top 0.61: CON304.2 98.74,8.89 98.42,8.57 v98.42,4.45 | v84.45,4.76 v84.45,7.94 | v79.06,7.94 v79.06,18.41
  Bottom 0.61: v98.42,4.45 94.66,4.45 X204.6 84.63,4.58 v84.45,4.76 | v84.45,7.94 v79.06,7.94 | v79.06,18.41 REL204.6
SCH-4-R  (via drill 0.3)
  Top 0.61: REL204.8 v81.28,11.43
  Bottom 0.61: v81.28,11.43 94.36,11.43 X204.4
SCK  (via drill 0.3)
  Top 0.406: v36.51,58.74 36.51,26.04 36.2,25.72 36.2,20 v37.47,18.41 IC104.13 37.47,14.92 36.2,13.65 36.2,3.49 36.83,2.86 44.45,2.86 45.09,3.49 IC102.6
  Bottom 0.406: IC101.8 v36.51,58.74 | SV101.3 20.95,13.97 20,14.92 20,17.46 20.95,18.41 v37.47,18.41
SEL1  (via drill 0.3)
  Top 0.61: LED205.K 89.53,81.6 89.53,91.76 LED206.A v87.95,96.84 | REL201.13 65.41,91.76 64.77,92.39 64.77,98.42 65.41,99.06 81.28,99.06 v83.5,96.84 | v54.61,66.36 v54.61,77.79 | v73.98,80.01 73.98,89.22 73.34,89.85 70.8,89.85 v69.85,88.9
  Bottom 0.61: v83.5,96.84 v87.95,96.84 | IC101.36 v54.61,66.36 | v54.61,77.79 59.37,77.79 60.33,78.74 72.71,78.74 v73.98,80.01 | v69.85,88.9 65.09,88.9 64.77,89.22 64.77,90.49 REL201.13
SEL2  (via drill 0.3)
  Top 0.61: LED201.K 89.53,57.15 89.53,67.31 LED202.A | v71.12,67.31 REL202.13
  Bottom 0.61: LED202.A 87.31,68.9 85.72,67.31 v71.12,67.31 63.82,67.31 62.87,66.36 57.78,66.36 55.24,63.82 IC101.35
SEL3  (via drill 0.3)
  Top 0.61: LED207.K 89.53,32.7 89.53,42.86 LED208.A v87.95,49.85 | REL203.13 v71.12,49.85
  Bottom 0.61: v87.95,49.85 v71.12,49.85 69.22,49.85 67.94,51.12 62.55,51.12 61.91,51.75 61.91,52.39 60.96,53.34 57.47,53.34 56.83,53.98 56.83,60.01 55.56,61.28 IC101.34
SEL4  (via drill 0.3)
  Top 0.61: LED203.K 89.53,8.26 89.53,18.41 LED204.A v87.95,27.62 | v74.61,26.04 v74.61,32.7 | v46.99,32.07 46.99,58.42 47.31,58.74 IC101.33
  Bottom 0.61: REL204.13 v74.61,26.04 | v87.95,27.62 85.41,27.62 80.33,32.7 v74.61,32.7 63.18,32.7 62.55,32.07 v46.99,32.07
SPG
  Top 0.406: R107.2 R108.1 45.72,77.15 46.35,76.52 IC101.40
V-NETZTEIL1
  Top 1.016: CON101.1 19.05,90.49 21.91,93.34 D103.A

### Text on the board
Bottom: MBCAN-Projekt | (c) Dr.-Ing. Th. Wiesner | 23.03.2024 | mbc83.brd | bottom
tNames: HW: 24.03.23 | +18V | DC | (c) Dr.-Ing. Th. Wiesner | MBCAN-Projekt | IN | OUT | mbc-83